# Altium schematic sheet MCU.SchDoc
size A4; SheetNumber: 1; SheetTotal: 5
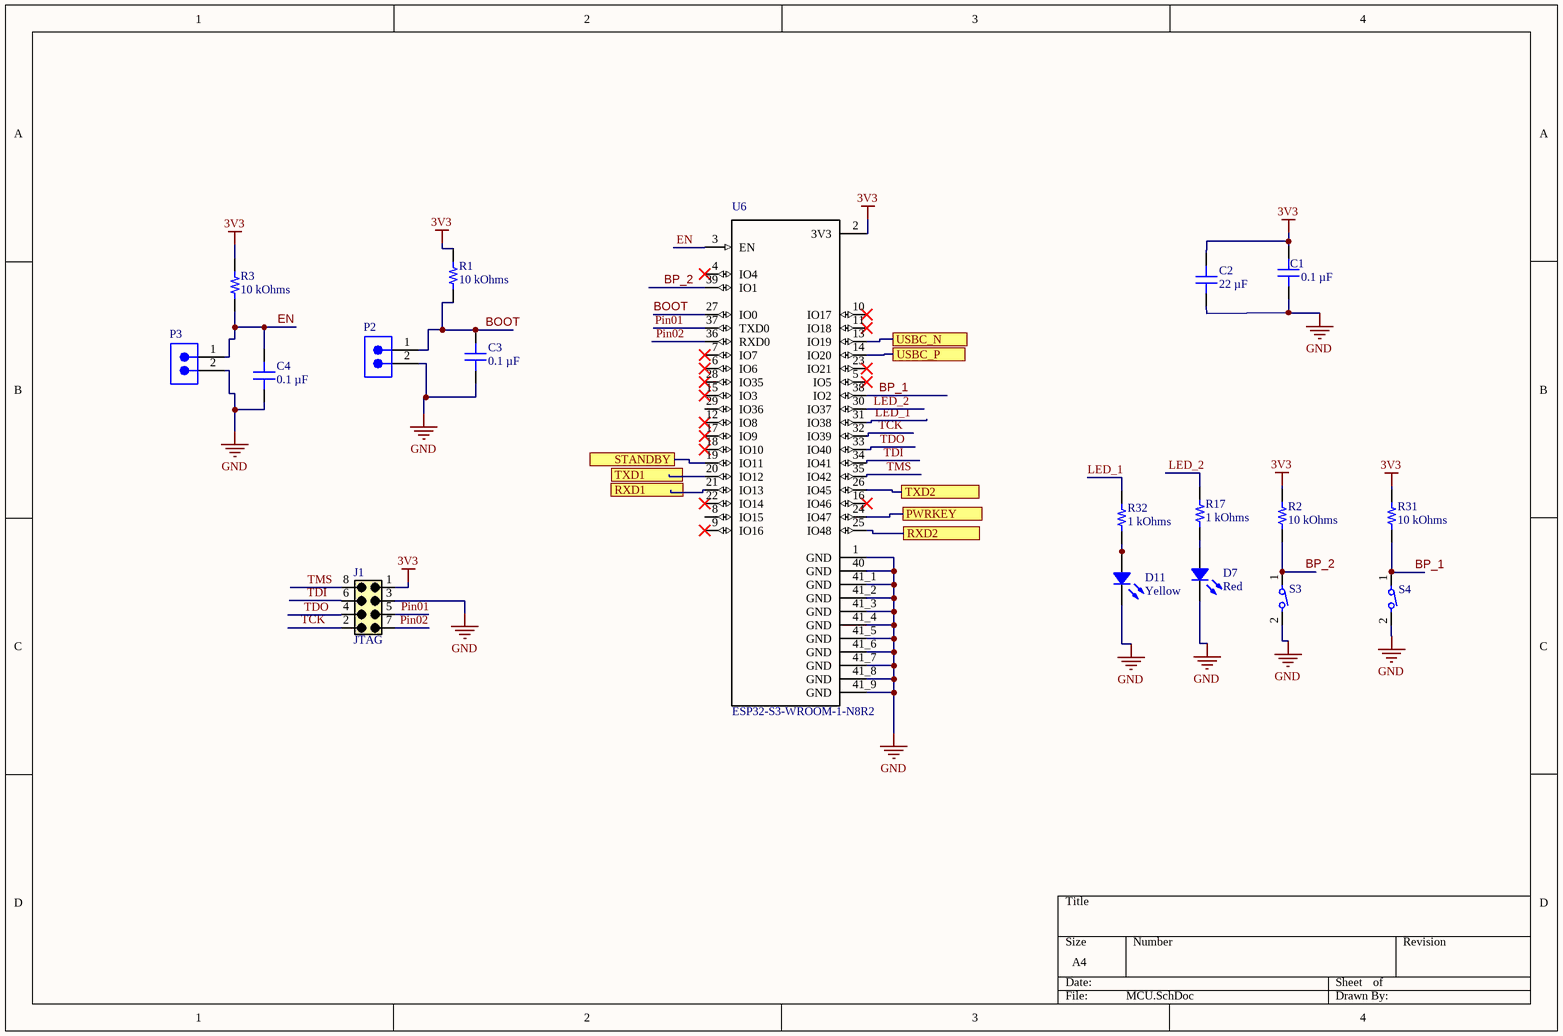
[diagram p0: MCU.SchDoc]

## Parts
C1  0.1 µF  [CAP 0402_1005]
C2  22 µF  [CAP 0805_2012]
C3  0.1 µF  [CAP 0402_1005]
C4  0.1 µF  [CAP 0402_1005]
D7  Red  [LED 1206_3216 RED]
D11  Yellow  [LED 1206_3216 YELLOW]
J1  JTAG  [61300821121]
P2  MTLW-102-05-G-S-172  [SMTC-MTLW-102-05-X-S-172]  (value not drawn)
P3  MTLW-102-05-G-S-172  [SMTC-MTLW-102-05-X-S-172]  (value not drawn)
R1  10 kOhms  [RES 0402_1005]
R2  10 kOhms  [RES 0402_1005]
R3  10 kOhms  [RES 0402_1005]
R17  1 kOhms  [RES 0402_1005]
R31  10 kOhms  [RES 0402_1005]
R32  1 kOhms  [RES 0402_1005]
S3  434123025816  [434123025816]  (value not drawn)
S4  434123025816  [434123025816]  (value not drawn)
U6  ESP32-S3-WROOM-1-N8R2  [*XCVR_ESP32-S3-WROOM-1-N8R2_ESP32-S3-WROOM-1-N8R2(Primary)]

## Ports
PWRKEY, RXD1, RXD2, STANDBY, TXD1, TXD2, USBC_N, USBC_P

## Nets
3V3: C1.2 C2.2 J1.1 R1.2 R2.2 R3.2 R31.2 U6.2(3V3)
GND: C1.1 C2.1 C3.1 C4.1 D7.2 D11.2 J1.3 P2.2 P3.2 S3.2 S4.2 U6.1(GND) U6.40(GND) U6.41_1(GND) U6.41_2(GND) U6.41_3(GND) U6.41_4(GND) U6.41_5(GND) U6.41_6(GND) U6.41_7(GND) U6.41_8(GND) U6.41_9(GND)
BOOT: C3.2 P2.1 R1.1 U6.27(IO0)
BP_1: R31.1 S4.1 U6.38(IO2)
BP_2: R2.1 S3.1 U6.39(IO1)
EN: C4.2 P3.1 R3.1 U6.3(EN)
LED_1: R32.2 U6.31(IO38)
LED_2: R17.2 U6.30(IO37)
Pin01: J1.5 U6.37(TXD0)
Pin02: J1.7 U6.36(RXD0)
PWRKEY: U6.24(IO47) ; port PWRKEY
RXD2: U6.25(IO48) ; port RXD2
STANDBY: U6.19(IO11) ; port STANDBY
TCK: J1.2 U6.32(IO39)
TDI: J1.6 U6.34(IO41)
TDO: J1.4 U6.33(IO40)
TMS: J1.8 U6.35(IO42)
TXD2: U6.26(IO45) ; port TXD2
USBC_N: U6.13(IO19) ; port USBC_N
USBC_P: U6.14(IO20) ; port USBC_P
NetD7_1: D7.1 R17.1
NetD11_1: D11.1 R32.1

Not connected (* = marked no-connect by the designer): U6 4(IO4)* 5(IO5)* 6(IO6)* 7(IO7)* 8(IO15) 9(IO16)* 10(IO17)* 11(IO18)* 12(IO8)* 15(IO3)* 16(IO46)* 17(IO9)* 18(IO10)* 20(IO12) 21(IO13) 22(IO14)* 23(IO21)* 28(IO35)* 29(IO36)

## Library data of the parts
C1 C3 C4 = 885012105001: CAP CER 0.1UF 6.3V X5R 0402; manufacturer: Würth Elektronik; Tolerance: ±20%; Part Number: 885012105001; Capacitance: 0.1 µF; Applications: General Purpose; componentlink1description: Datasheet; componentlink1url: https://katalog.we-online.de/pbs/datasheet/885012105001.pdf; componentlink2description: DigiKey Link; componentlink2url: https://www.digikey.com/en/products/detail/würth-elektronik/885012105001/5453333; Device Package: 0402 (1005 Metric); lastupdated: 06/04/2026 7:11:10 PM; Lifecycle Status: Active; Minimum Order: 1; Mounting Type: Surface Mount, MLCC; Operating Temperature: -55°C ~ 85°C; Package / Case: 0402 (1005 Metric); packaging: TapeAndReel; partid: 1931; Part Status: Active; price: 0.01; series: WCAP-CSGP; Size / Dimension: 0.039" L x 0.020" W (1.00mm x 0.50mm); Supplier 1: DigiKey; Supplier Part Number 1: 732-7478-1-ND; Temperature Coefficient: X5R; Thickness (Max): 0.022" (0.55mm); value: 0.1 µF; Voltage - Rated: 6.3V
C2 = CM21X5R226M16AT: 0805 X5R 22UF20% 16V; manufacturer: KYOCERA AVX; Tolerance: ±20%; Part Number: CM21X5R226M16AT; Capacitance: 22 µF; Applications: General Purpose; componentlink1description: Datasheet; componentlink1url: https://ele.kyocera.com/assets/products/capacitor/CM_Series_e.pdf; componentlink2description: DigiKey Link; componentlink2url: https://www.digikey.com/en/products/detail/kyocera-avx/CM21X5R226M16AT/17866395; Device Package: 0805 (2012 Metric); lastupdated: 06/04/2026 7:30:11 PM; Lifecycle Status: Active; Minimum Order: 1; Mounting Type: Surface Mount, MLCC; Operating Temperature: -55°C ~ 85°C; Package / Case: 0805 (2012 Metric); packaging: TapeAndReel; partid: 55250; Part Status: Active; price: 0.08; series: CM; Size / Dimension: 0.079" L x 0.049" W (2.00mm x 1.25mm); Supplier 1: DigiKey; Supplier Part Number 1: 478-CM21X5R226M16ATCT-ND; Temperature Coefficient: X5R; Thickness (Max): 0.057" (1.45mm); value: 22 µF; Voltage - Rated: 16V
D7 = SML-LX1206SRC-TR: LED RED CLEAR 1206 SMD; Manufacturer: Lumex Opto/Components Inc.; Configuration: Standard; Current - Test: 20mA; Lens Color: Colorless; Lens Size: 2.00mm x 1.50mm; Lens Style: Rectangle with Flat Top; Millicandela Rating: 25mcd; Viewing Angle: 140°; Voltage - Forward (Vf) (Typ): 1.7V; Wavelength - Peak: 660nm; Part Number: SML-LX1206SRC-TR; Color: Red; ComponentLink1Description: Datasheet; ComponentLink1URL: //media.digikey.com/pdf/Data%20Sheets/Lumex%20PDFs/SML-LX1206SRC-TR.pdf; ComponentLink2Description: DigiKey Link; ComponentLink2URL: https://www.digikey.com/en/products/detail/lumex-opto-components-inc/SML-LX1206SRC-TR/229141; Device Package: 1206 (3216 Metric); Height (Max): 1.10mm; LastUpdated: 05/04/2026 8:39:22 PM; Lens Transparency: Clear; Lifecycle Status: Active; Minimum Order: 1; Mounting Type: Surface Mount; Package / Case: 1206 (3216 Metric); Packaging: TapeAndReel; PartId: 224; Part Status: Active; Price: 0.07; Series: -; Size / Dimension: 3.20mm L x 1.60mm W; Supplier 1: DigiKey; Supplier Part Number 1: 67-1359-1-ND; Supplier Device Package: 1206; Value: Red
D11 = CMD11-21VYC/TR8: LED YELLOW CLEAR 1206 SMD; Manufacturer: Visual Communications Company - VCC; Configuration: Standard; Current - Test: 20mA; Lens Color: 1.50mm; Lens Size: 1.10mm Dia; Lens Style: Round with Flat Top; Millicandela Rating: 6mcd; Viewing Angle: 20°; Voltage - Forward (Vf) (Typ): 2V; Wavelength - Peak: 585nm; Part Number: CMD11-21VYC/TR8; Color: Yellow; ComponentLink1Description: Datasheet; ComponentLink1URL: https://vcclite.com/wp-content/uploads/wpallimport/files/files/CMD11-21%20SMT%20LEDs%201206%20Package%20Size.pdf; ComponentLink2Description: DigiKey Link; ComponentLink2URL: https://www.digikey.com/en/products/detail/visual-communications-company-vcc/CMD11-21VYC-TR8/254830; Device Package: 1206 (3216 Metric); Height (Max): 1.50mm; LastUpdated: 05/04/2026 8:40:44 PM; Lens Transparency: Clear; Lifecycle Status: Active; Minimum Order: 1; Mounting Type: Surface Mount; Package / Case: 1206 (3216 Metric); Packaging: TapeAndReel; PartId: 6; Part Status: Active; Price: 0.25; Series: -; Size / Dimension: 3.00mm L x 1.50mm W; Supplier 1: DigiKey; Supplier Part Number 1: 28-CMD11-21VYC/TR8CT-ND; Supplier Device Package: 1206; Value: Yellow
J1 = 6130XX21121_61300821121: Connector Header Through Hole 8 position 0.100 (2.54mm); MF: Wurth Electronics; SnapEDA_Link: https://www.snapeda.com/parts/61300821121/Wurth+Electronics/view-part/?ref=snap; Package: None; Value: *; MP: 61300821121; Check_prices: https://www.snapeda.com/parts/61300821121/Wurth+Electronics/view-part/?ref=eda
P2 P3 = CMP-1024-00064-1: Low Profile .025" SQ Post Header, Through-hole, Vertical, -55 to 125 degC, 2.54 mm Pitch, 2-Pin, Male, RoHS; Manufacturer: Samtec; Pitch: 2.54 mm; ComponentLink2URL: http://www.samtec.com/documents/webfiles/pdf/MTLW_TH.PDF; PackageDescription: Low Profile Terminal Assembly; ComponentLink3URL: http://www.samtec.com/documents/webfiles/cpdf/MTLW-1XX-XX-XX-X-XXX-XX-XX-MKT1.pdf; PackageReference: MTLW-102-05-X-S-172; Mounting Technology: Through-hole; ComponentLink2Description: Datasheet; PackageVersion: T, 6/1991; Orientation: Vertical; DatasheetVersion: F-214; RoHS: True; ComponentLink3Description: Package Specification; ComponentLink1URL: http://www.samtec.com; Temperature Range: -55 to 125 degC; PartNumber: MTLW-102-05-G-S-172; ComponentLink1Description: Manufacturer URL
R1-R3 R31 = TNPU040210K0BZEP00: TNPU0402 10K 0.1% T-16 EP1 E3; Manufacturer: Vishay Dale; Power (Watts): 0.063W, 1/16W; Temperature Coefficient: ±5ppm/°C; Part Number: TNPU040210K0BZEP00; Value: 10 kOhms; ComponentLink1Description: Datasheet; ComponentLink1URL: http://www.vishay.com/docs/28779/tnpue3.pdf; ComponentLink2Description: DigiKey Link; ComponentLink2URL: https://www.digikey.com/en/products/detail/vishay-dale/TNPU040210K0BZEP00/10668512; Composition: Thin Film; Device Package: 0402 (1005 Metric); Features: Anti-Sulfur, Automotive AEC-Q200, Moisture Resistant; Height - Seated (Max): 0.016" (0.40mm); LastUpdated: 09/02/2024 8:29:39 PM; Lifecycle Status: Active; Minimum Order: 1; Number of Terminations: 2; Operating Temperature: -55°C ~ 125°C; Package / Case: 0402 (1005 Metric); Packaging: TapeAndReel; PartId: 49938; Part Status: Active; Price: 0.67; Ratings: AEC-Q200; Resistance: 10 kOhms; Series: TNPU e3; Size / Dimension: 0.039" L x 0.020" W (1.00mm x 0.50mm); Supplier 1: DigiKey; Supplier Part Number 1: 541-TNPU040210K0BZEP00CT-ND; Supplier Device Package: 0402; Tolerance: ±0.1%
R17 R32 = TNPU04021K00BZEP00: TNPU0402 1K0 0.1% T-16 EP1 E3; Manufacturer: Vishay Dale; Power (Watts): 0.063W, 1/16W; Temperature Coefficient: ±5ppm/°C; Part Number: TNPU04021K00BZEP00; Value: 1 kOhms; ComponentLink1Description: Datasheet; ComponentLink1URL: http://www.vishay.com/docs/28779/tnpue3.pdf; ComponentLink2Description: DigiKey Link; ComponentLink2URL: https://www.digikey.com/en/products/detail/vishay-dale/TNPU04021K00BZEP00/10668523; Composition: Thin Film; Device Package: 0402 (1005 Metric); Features: Anti-Sulfur, Automotive AEC-Q200, Moisture Resistant; Height - Seated (Max): 0.016" (0.40mm); LastUpdated: 09/02/2024 8:29:39 PM; Lifecycle Status: Active; Minimum Order: 1; Number of Terminations: 2; Operating Temperature: -55°C ~ 125°C; Package / Case: 0402 (1005 Metric); Packaging: TapeAndReel; PartId: 49940; Part Status: Active; Price: 0.67; Ratings: AEC-Q200; Resistance: 1 kOhms; Series: TNPU e3; Size / Dimension: 0.039" L x 0.020" W (1.00mm x 0.50mm); Supplier 1: DigiKey; Supplier Part Number 1: 541-TNPU04021K00BZEP00CT-ND; Supplier Device Package: 0402; Tolerance: ±0.1%
S3 S4 = 434123025816: Tactile Switch SPST-NO Top Actuated Surface Mount; MF: WÃ¼rth Elektronik; SnapEDA_Link: https://www.snapeda.com/parts/434123025816/W%25C3%25BCrth+Elektronik+Midcom/view-part/?ref=snap; Package: None; Value: *; MP: 434123025816; Check_prices: https://www.snapeda.com/parts/434123025816/W%25C3%25BCrth+Elektronik+Midcom/view-part/?ref=eda
U6 = ESP32-S3-WROOM-1-N8R2: WiFi 802.11a/b/g/n, Bluetooth v5.0 Transceiver Module 2.4GHz Antenna Not Included -; MF: Espressif Systems; Package: NON STANDARD Espressif Systems; Price: None; SnapEDA_Link: https://www.snapeda.com/parts/ESP32-S3-WROOM-1-N8R2/Espressif+Systems/view-part/?ref=snap; MP: ESP32-S3-WROOM-1-N8R2; Availability: In Stock; Check_prices: https://www.snapeda.com/parts/ESP32-S3-WROOM-1-N8R2/Espressif+Systems/view-part/?ref=eda; Value: *